# Altium schematic sheet Temp_sensor_schem.SchDoc
size A; SheetNumber: 1; SheetTotal: 1
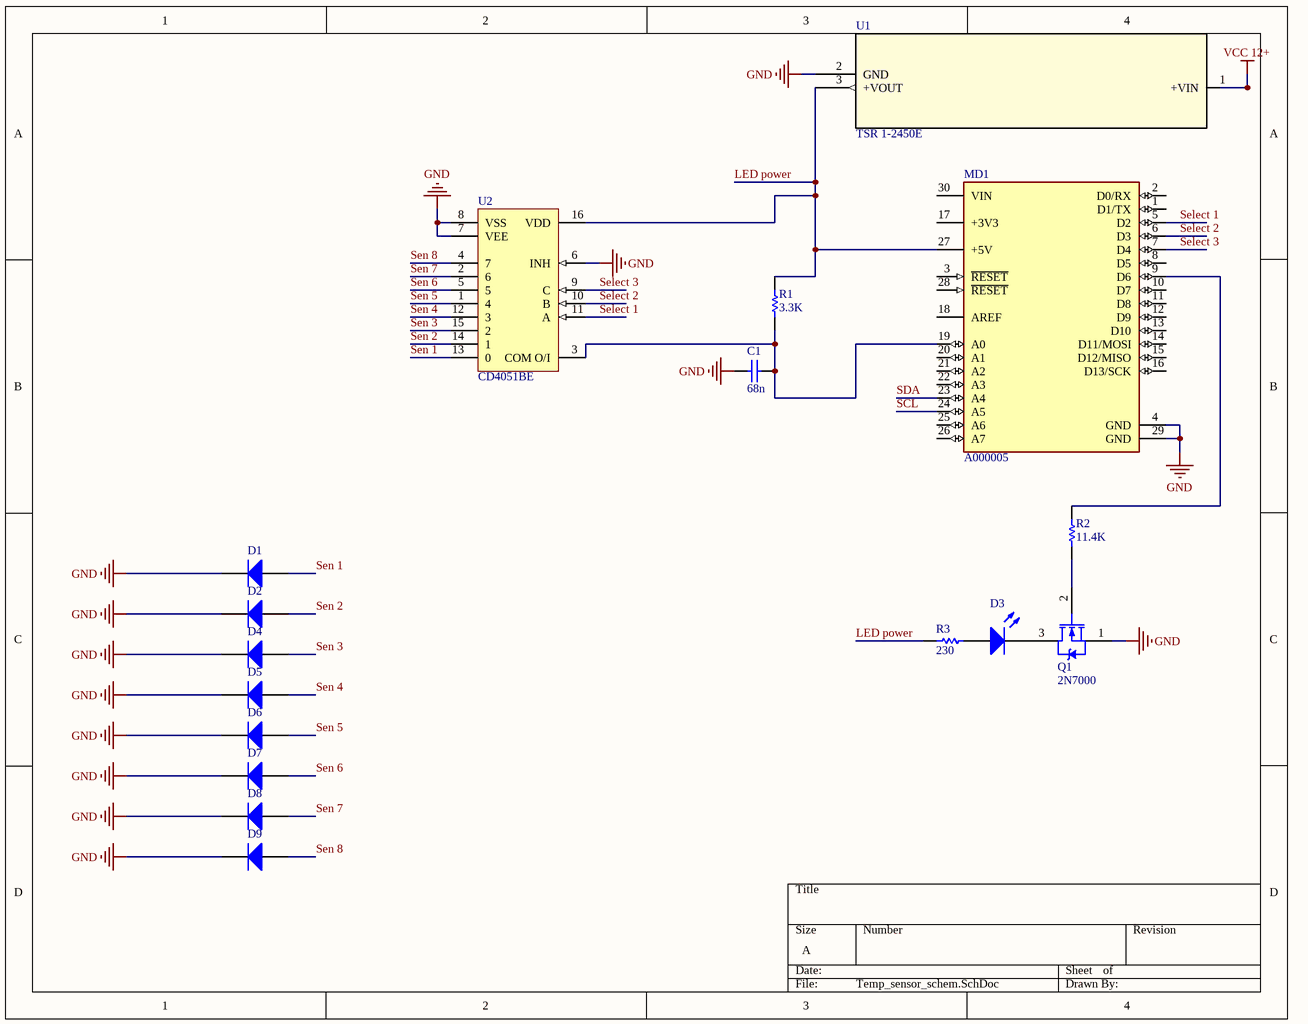
[diagram p0: Temp_sensor_schem.SchDoc]

## Parts
C1  value 68n  (hidden comment: Capacitor)
D1  Diode  (value not drawn)
D2  Diode  (value not drawn)
D3  Light-Emitting Diode  (value not drawn)
D4  Diode  (value not drawn)
D5  Diode  (value not drawn)
D6  Diode  (value not drawn)
D7  Diode  (value not drawn)
D8  Diode  (value not drawn)
D9  Diode  (value not drawn)
MD1  A000005  [FP-A000005-MFG]
Q1  2N7000  [ONSC-TO-92-3-29-11]
R1  value 3.3K  (hidden comment: Resistor)
R2  value 11.4K  (hidden comment: Resistor)
R3  value 230  (hidden comment: Resistor)
U1  TSR 1-2450E  [TSR 1E_TRP]
U2  CD4051BE  [N0016A]

## Nets
GND: C1.1 D1.2(K) D2.2(K) D4.2(K) D5.2(K) D6.2(K) D7.2(K) D8.2(K) D9.2(K) MD1.4(GND) MD1.29(GND) Q1.1(S) U1.2(GND) U2.6(INH) U2.7(VEE) U2.8(VSS)
VCC 12+: U1.1(+VIN)
LED power: MD1.27(+5V) R1.1 R3.1 U1.3(+VOUT) U2.16(VDD)
SCL: MD1.24(A5)
SDA: MD1.23(A4)
Select 1: MD1.5(D2) U2.11(A)
Select 2: MD1.6(D3) U2.10(B)
Select 3: MD1.7(D4) U2.9(C)
Sen 1: D1.1(A) U2.13(0)
Sen 2: D2.1(A) U2.14(1)
Sen 3: D4.1(A) U2.15(2)
Sen 4: D5.1(A) U2.12(3)
Sen 5: D6.1(A) U2.1(4)
Sen 6: D7.1(A) U2.5
Sen 7: D8.1(A) U2.2(6)
Sen 8: D9.1(A) U2.4(7)
NetC1_2: C1.2 MD1.19(A0) R1.2 U2.3(COM_O/I)
NetD3_2: D3.2(K) Q1.3(D)
NetMD1_9: MD1.9(D6) R2.2
NetQ1_2: Q1.2(G) R2.1

Not connected (* = marked no-connect by the designer): D3 1(A); MD1 1(D1/TX) 2(D0/RX) 3(~{RESET}) 8(D5) 10(D7) 11(D8) 12(D9) 13(D10) 14(D11/MOSI) 15(D12/MISO) 16(D13/SCK) 17(+3V3) 18(AREF) 20(A1) 21(A2) 22(A3) 25(A6) 26(A7) 28(~{RESET}) 30(VIN); R3 2

## Library data of the parts
C1 = Capacitor: SimulationGenericComponent: True
D1 D2 D4-D9 = Diode: AF: 1; BV: 0; BV_MAX: 1e99; EG: 1.11; FC: 0.5; IBV: 0.001; ISR: 1e-14; MJSW: 0.33; NTUN: 30; TNOM: 27; XTI: 3; SimulationGenericComponent: True; CJO: 0; CJP: 0; CTA: 0; CTP: 0; FCS: 0.5; FV_MAX: 1e99; IKF: 0; IKR: 0; JSW: 0; JTUN: 0; JTUNSW: 0; KEG: 1; KF: 0; LEVEL: 1; N: 1; NBV: 1; NR: 1; NS: 1; PHP: 1; RS: 0; TCV: 0; TLEV: 0; TLEVC: 0; TM1: 0; TM2: 0; TPB: 0; TPHP: 0; TRS: 0; TRS2: 0; TT: 0; TTT1: 0; TTT2: 0; VJ: 1; XTITUN: 3; IS: 1e-14
D3 = LED: AF: 1; BV: 0; BV_MAX: 1e99; EG: 1.11; FC: 0.5; IBV: 0.001; IS: 1e-14; MJSW: 0.33; NTUN: 30; TNOM: 27; XTI: 3; SimulationGenericComponent: True; CJO: 0; CJP: 0; CTA: 0; CTP: 0; FCS: 0.5; FV_MAX: 1e99; IKF: 0; IKR: 0; ISR: 1e-14; JSW: 0; JTUN: 0; JTUNSW: 0; KEG: 1; KF: 0; LEVEL: 1; N: 1; NBV: 1; NR: 1; NS: 1; PHP: 1; RS: 0; TCV: 0; TLEV: 0; TLEVC: 0; TM1: 0; TM2: 0; TPB: 0; TPHP: 0; TRS: 0; TRS2: 0; TT: 0; TTT1: 0; TTT2: 0; VJ: 1; XTITUN: 3
MD1 = CMP-189986-000002-1: ARDUINO NANO ATMEGA328 EVAL BRD; Number of Bits: 8; Evaluation Kit: Yes; Operating Supply Voltage: 12V; Interface: I2C; Data Bus Width: 8b; Core Architecture: AVR; Packaging: Bulk; Length: 7inch; Package Quantity: 50; Width: 5inch; REACH SVHC: No SVHC; Weight: 0.358383oz; Series: AVR® ATmega; Height: 0.25inch
Q1 = CMP-1058-00936-1: Small Signal MOSFET, 200 mA, 60 V, N-Channel, 3-Pin TO-92, Bulk Box; Manufacturer: On Semiconductor; Ciss Typ (pF): 60; VGS(th) Max (V): 3; Crss Typ (pF): 5; Channel Polarity: N Channel; VGS Max (V): 20; Configuration: Single; PD Max (W): 0.35; Coss Typ (pF): 25; ID Max (A): 0.2; PackageVersion: Rev. AM; ComponentLink3URL: http://www.onsemi.cn/pub_link/Collateral/2N6426-D.PDF; ComponentLink2URL: http://www.onsemi.com/pub_link/Collateral/2N7000-D.PDF; DatasheetVersion: Rev. 8; Mounting Technology: Through Hole; V(BR)DSS Min (V): 60; PartNumber: 2N7000; PackageDescription: 3-Pin Transistor Outline, Body 4.825 x 3.685 mm, Pitch 1.27 mm; ComponentLink2Description: Datasheet; ComponentLink1URL: http://www.onsemi.com/; PackageReference: TO-92-3-29-11_AM_SL; Packing: Bulk Box; ComponentLink1Description: Manufacturer URL; Package Type: TO-92; ComponentLink3Description: Package Specification
R1-R3 = Resistor: TC1: 0; SimulationGenericComponent: True; TC2: 0
U1 = CMP-49942-000019-2: DC DC CONVERTER 5V; NexarPartId: 109016055; Min Supply Voltage: 7V; Output Current: 1A; Max Supply Voltage: 36V; Switching Frequency: 520kHz; Number of Outputs: 1; Max Operating Temperature: 85°C; Height: 10.7mm; Output Voltage: 5V; Min Operating Temperature: -40°C
U2 = CMP-1575-00059-4: CMOS Single 8-Channel Analog Multiplexer/Demultiplexer with Logic-Level Conversion, N0016A, TUBE; Manufacturer: Texas Instruments; VCC(Max)(V): 18; ICC(Typ)(mA): 0.00008; Output Drive (IOL/IOH)(Max)(mA): 1; Bandwidth(Max)(MHz): 20; Rating: Military; VCC(Min)(V): 5; Configuration: 1 X 1：8 MUX; Crosstalk: Yes; Ron(Max)(Ohms): 240; Ron(Typ)(Ohms): 125; DatasheetVersion: SCHS047G; Output Type: CMOS; PackageVersion: http://www.ti.com/lit/ml/mpdi002c/mpdi002c.pdf; Operating Temperature Range(C): -55 to 125; Generic Part Number: CD4051B; PackageReference: N0016A; Code_JEDEC: MS-001